# Altium schematic sheet PERIPHERAL POWER SUPPLY.SchDoc
size A3; SheetNumber: 16; SheetTotal: 17
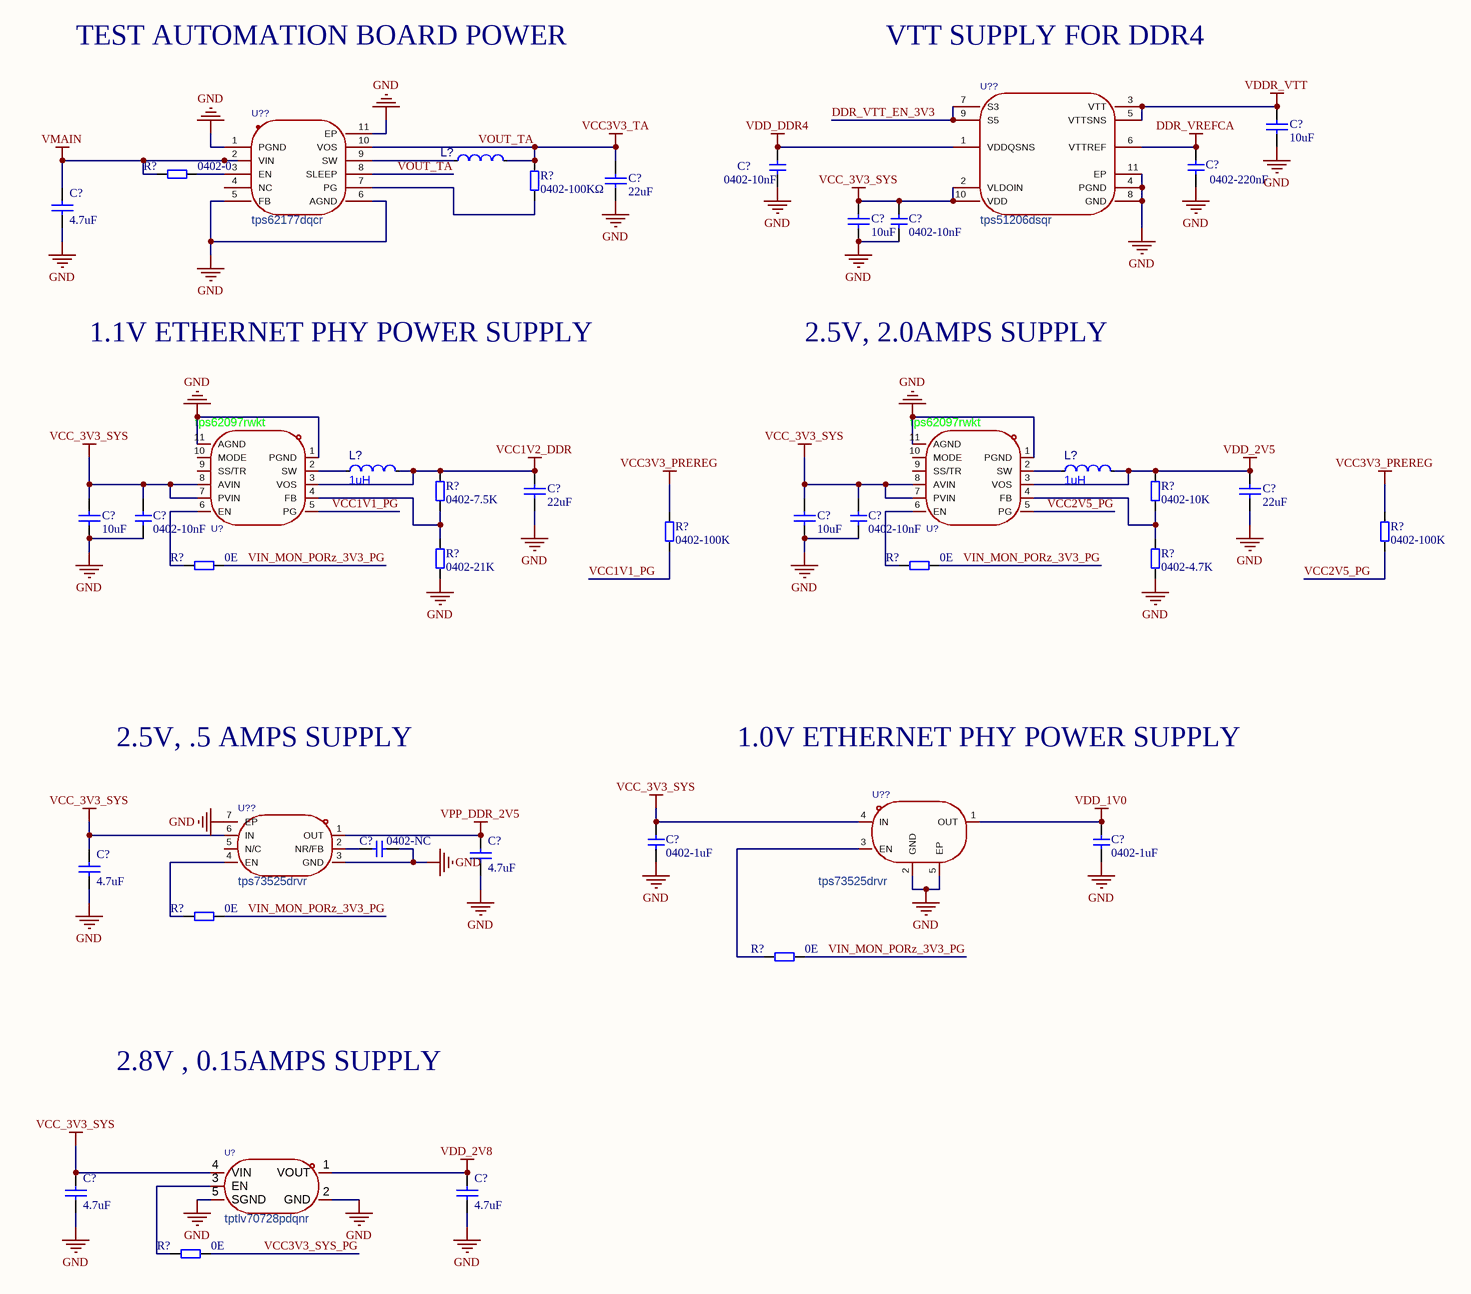
[diagram p0: PERIPHERAL POWER SUPPLY.SchDoc]

## Parts
(Parts that share a designator on the sheet are numbered #1, #2 ... from top to bottom, then left to right.)
C?#1  10uF  [C0603]
C?#2  0402-10nF  [C0402]
C?#3  0402-220nF  [C0402]
C?#4  22uF  [C0805]
C?#5  4.7uF  [C0603]
C?#6  0402-10nF  [C0402]
C?#7  10uF  [C0603]
C?#8  22uF  [C0805]
C?#9  22uF  [C0805]
C?#10  0402-10nF  [C0402]
C?#11  0402-10nF  [C0402]
C?#12  10uF  [C0603]
C?#13  10uF  [C0603]
C?#14  0402-1uF  [C0402]
C?#15  0402-1uF  [C0402]
C?#16  0402-NC  [C0402]
C?#17  4.7uF  [C0603]
C?#18  4.7uF  [C0603]
C?#19  4.7uF  [C0603]
C?#20  4.7uF  [C0603]
L?#1  fxl0630-100-m  [IND-SMD_L7.3-W6.8]  (value not drawn)
L?#2  1uH  [L0603]
L?#3  1uH  [L0603]
R?#1  0402-0  [R0402]
R?#2  0402-100KΩ  [R0402]
R?#3  0402-7.5K  [R0402]
R?#4  0402-10K  [R0402]
R?#5  0402-100K  [R0402]
R?#6  0402-100K  [R0402]
R?#7  0E  [R0402]
R?#8  0E  [R0402]
R?#9  0402-21K  [R0402]
R?#10  0402-4.7K  [R0402]
R?#11  0E  [R0402]
R?#12  0E  [R0402]
R?#13  0E  [R0402]
U?#1  tps62097rwkt  [VQFN-11_L2.0-W2.0-P0.50-TL_TI_RWK]
U?#2  tps62097rwkt  [VQFN-11_L2.0-W2.0-P0.50-TL_TI_RWK]
U?#3  tptlv70728pdqnr  [UDFN-4_L1.0-W1.0-P0.65-TL]
U??#1  tps51206dsqr  [SON-10_L2.0-W2.0-P0.40-TL-EP]
U??#2  tps62177dqcr  [WSON-10_L3.0-W2.0-P0.50-BL-EP]
U??#3  tps73525drvr  [WSON-6_L2.0-W2.0-P0.65-TL-EP]
U??#4  tps73525drvr  [WSON-6_L2.0-W2.0-P0.65-TL-EP]

## Nets
DDR_VREFCA: C?#3.1 U??#1.6(VTTREF)
GND: C?#1.1 C?#2.2 C?#3.2 C?#4.1 C?#5.1 C?#6.2 C?#7.1 C?#8.1 C?#9.1 C?#10.2 C?#11.2 C?#12.1 C?#13.1 C?#14.2 C?#15.2 C?#16.2 C?#17.1 C?#18.1 C?#19.1 C?#20.1 R?#9.1 R?#10.1 U?#1.1(PGND) U?#1.11(AGND) U?#2.1(PGND) U?#2.11(AGND) U?#3.2(GND) U?#3.5(SGND) U??#1.4(PGND) U??#1.8(GND) U??#1.11(EP) U??#2.1(PGND) U??#2.5(FB) U??#2.6(AGND) U??#2.11(EP) U??#3.2(GND) U??#3.5(EP) U??#4.3(GND) U??#4.7(EP)
VCC1V2_DDR: C?#8.2 L?#2.2 R?#3.2 U?#1.3(VOS)
VCC3V3_PREREG: R?#5.2 R?#6.2
VCC_3V3_SYS: C?#6.1 C?#7.2 C?#10.1 C?#11.1 C?#12.2 C?#13.2 C?#14.1 C?#18.2 C?#19.2 U?#1.7(PVIN) U?#1.8(AVIN) U?#2.7(PVIN) U?#2.8(AVIN) U?#3.4(VIN) U??#1.2(VLDOIN) U??#1.10(VDD) U??#3.4(IN) U??#4.6(IN)
VDD_1V0: C?#15.1 U??#3.1(OUT)
VDD_2V5: C?#9.2 L?#3.2 R?#4.2 U?#2.3(VOS)
VDD_2V8: C?#20.2 U?#3.1(VOUT)
VDD_DDR4: C?#2.1 U??#1.1(VDDQSNS)
VDDR_VTT: C?#1.2 U??#1.3(VTT) U??#1.5(VTTSNS)
VMAIN: C?#5.2 R?#1.1 U??#2.2(VIN)
VOUT_TA: C?#4.2 L?#1.2 R?#2.2 U??#2.8(SLEEP) U??#2.10(VOS)  [also labelled VCC3V3_TA]
VPP_DDR_2V5: C?#17.2 U??#4.1(OUT)
DDR_VTT_EN_3V3: U??#1.7(S3) U??#1.9(S5)
VCC1V1_PG: R?#5.1 U?#1.5(PG)
VCC2V5_PG: R?#6.1 U?#2.5(PG)
VCC3V3_SYS_PG: R?#13.1
VIN_MON_PORz_3V3_PG: R?#7.1 R?#8.1 R?#11.1 R?#12.1
NetC?#16_1: C?#16.1 U??#4.2(NR/FB)
NetL?#1_1: L?#1.1 U??#2.9(SW)
NetL?#2_1: L?#2.1 U?#1.2(SW)
NetL?#3_1: L?#3.1 U?#2.2(SW)
NetR?#1_2: R?#1.2 U??#2.3(EN)
NetR?#2_1: R?#2.1 U??#2.7(PG)
NetR?#3_1: R?#3.1 R?#9.2 U?#1.4(FB)
NetR?#4_1: R?#4.1 R?#10.2 U?#2.4(FB)
NetR?#7_2: R?#7.2 U?#1.6(EN)
NetR?#8_2: R?#8.2 U?#2.6(EN)
NetR?#11_2: R?#11.2 U??#4.4(EN)
NetR?#12_2: R?#12.2 U??#3.3(EN)
NetR?#13_2: R?#13.2 U?#3.3(EN)

Not connected (* = marked no-connect by the designer): U?#1 9(SS/TR) 10(MODE); U?#2 9(SS/TR) 10(MODE); U??#2 4(NC); U??#4 5(N/C)

## Notes on the sheet
- TEST AUTOMATION BOARD POWER
- VTT SUPPLY FOR DDR4
- 1.1V ETHERNET PHY POWER SUPPLY
- 2.5V, 2.0AMPS SUPPLY
- 2.5V, .5 AMPS SUPPLY
- 1.0V ETHERNET PHY POWER SUPPLY
- 2.8V , 0.15AMPS SUPPLY

## Library data of the parts
C?#1 C?#5 C?#7 C?#12 C?#13 C?#17-C?#20 = C0603: Capacitor; Value: 104; Published: 8-Jun-2000; LatestRevisionDate: 17-Jul-2002; LatestRevisionNote: Re-released for DXP Platform.; Publisher: Altium Limited
C?#2 C?#3 C?#6 C?#10 C?#11 C?#14-C?#16 = C0402: 物料号: *; 物料描述: *
C?#4 C?#8 C?#9 = C0805: Capacitor; Value: 104; Published: 8-Jun-2000; LatestRevisionDate: 17-Jul-2002; LatestRevisionNote: Re-released for DXP Platform.; Publisher: Altium Limited
L?#1 = fxl0630-100-m: 电感值:6.8uH;精度:±20%;额定电流:4.5A;饱和电流(Isat):5.5A;类型:一体成型电感;; Manufacturer: cjiang(长江微电); AddInBom: yes; ModelId: e28854526ca747668ea12fbe1dd39a63; ModelName: IND-SMD_L7.3-W6.8-H3.0; ModelTransform: 292.125,267.716,0,0,0,0,0,0,0; Value: 10uH; Tolerance: ±20%; Current Rating: 4.5A; Current - Saturation(Isat): 5.5A; DC Resistance(DCR): 68mΩ; Type: 一体成型电感; Symbol: FXL0630-100-M; LCSC Part Name: 10uH ±20% 5.5A; SupplierPart: C167223; ManufacturerPart: FXL0630-100-M; Supplier Footprint: SMD,7x6.6mm; JLCPCB Part Class: Extended Part; Datasheet: https://item.szlcsc.com/datasheet/FXL0630-100-M/178606.html; Supplier: LCSC; ConvertToPcb: yes; FootprintName: IND-SMD_L7.3-W6.8; Ratings: -
L?#2 L?#3 = L0603: 小型化一体成型T-CORE，小体积，扁线工艺，感值小，1210​ 1uH ±20% 6A PCT322510-1R0-M; Manufacturer: Sunlord(顺络); Symbol: SDFL1608S100KTF; AddInBom: yes; ModelId: 2bc5ec593d464d6ba9807aec0b5673c2; ModelName: L0603_L1.6-W0.8-H0.5_BEAD; ModelTransform: 62.992,31.496,0,180,0,0,0.094,0.629,0; Value: 10uH; Tolerance: ±10%; Current Rating: 3mA; DC Resistance(DCR): 1.85Ω; Q @ Frequency: 30@2MHz; Frequency - Self Resonant: 17MHz; LCSC Part Name: 10uH ±10%; SupplierPart: C1035; ManufacturerPart: SDFL1608S100KTF; Supplier Footprint: 0603; JLCPCB Part Class: Basic Part; Datasheet: https://item.szlcsc.com/datasheet/SDFL1608S100KTF/1387.html; Supplier: LCSC; ConvertToPcb: yes; FootprintName: L0603; Current - Saturation (Isat): -; Ratings: -
R?#1-R?#13 = R0402: 片式电阻; 物料描述: 片式电阻器-0805-10KΩ-5%-JT; 物料号: NA
U?#1 U?#2 = tps62097rwkt: 功能类型:降压型;工作电压:2.5V~6V;输出电压:800mV~6V;输出电流:2A;输出类型:可调;; Manufacturer: TI(德州仪器); AddInBom: yes; Function: 降压型; Output Current: 2A; Frequency - Switching: 2.5MHz; Synchronous Rectifier: 是; Number of Outputs: 1; Topology: 降压式; Quiescent Current: 57uA; Switch tube (built-in/external): 内置; Output Type: 可调; Symbol: TPS62097RWKT; LCSC Part Name: 降压型 2A 2.5V~6V; SupplierPart: C2073254; ManufacturerPart: TPS62097RWKT; Supplier Footprint: VQFN-11(2x2); JLCPCB Part Class: Extended Part; Datasheet: https://www.ti.com/cn/lit/gpn/tps62097; Supplier: LCSC; ConvertToPcb: yes; FootprintName: VQFN-11_L2.0-W2.0-P0.50-TL_TI_RWK; Voltage - Supply: 2.5V~6V; Output Voltage: 800mV~6V; Operating Temperature: -40℃~+125℃@(TJ); Features: 轻载高效模式；可调软启动；输出放电；输出电压跟随；工作状态指示；打嗝限流
U?#3 = tptlv70728pdqnr: Manufacturer: TECH PUBLIC(台舟); AddInBom: yes; ModelId: 9c2eebc267f642aab45e7193d1ab7813; ModelTransform: 40.1574,39.37394,0,0,0,0,0,0,0; LCSC Part Name: TPTLV70728PDQNR; SupplierPart: C55191407; ManufacturerPart: TPTLV70728PDQNR; Supplier Footprint: DFN-4(1x1); JLCPCB Part Class: Extended Part; Datasheet: https://item.szlcsc.com/datasheet/TPTLV70728PDQNR/58985584.html; Supplier: LCSC; ConvertToPcb: yes; SymbolName: TPTLV70728PDQNR; FootprintName: UDFN-4_L1.0-W1.0-P0.65-TL; ModelName: UDFN-4_L1.0-W1.0-P0.65-TL
U??#1 = tps51206dsqr: 输出极性:正极;工作电压:6.5V;输出电压:500mV~900mV;输出电流:2A;电源纹波抑制比(PSRR):-;输出类型:-;; Manufacturer: TI(德州仪器); AddInBom: yes; ModelId: 67ee0328d4a549d7a6ffbda5a640ba02; ModelName: SON-10_L2.0-W2.0-H0.9-P0.40-TL-EP; ModelTransform: 78.74,79.527,0,270,0,0,0,0,0; Output Configuration: 正极; Voltage - Supply: 6.5V; Output Current: 2A; standby current: 170uA; Number of Outputs: 2; Symbol: TPS51206DSQR; LCSC Part Name: 500mV~900mV 2A 6.5V; SupplierPart: C88038; ManufacturerPart: TPS51206DSQR; Supplier Footprint: SON-10-EP(2x2); JLCPCB Part Class: Extended Part; Datasheet: https://www.ti.com/cn/lit/ds/symlink/tps51206.pdf; Supplier: LCSC; ConvertToPcb: yes; FootprintName: SON-10_L2.0-W2.0-P0.40-TL-EP; Output Voltage: 500mV~900mV; Power Supply Rejection Ratio (PSRR): -; Voltage Dropout: -; Noise: -; Features: 输入欠压保护；输出放电；热关断; Operating Temperature: -40℃~+85℃; Output Type: -
U??#2 = tps62177dqcr: 功能类型:降压型;工作电压:4.75V~28V;输出电压:3.3V;输出电流:500mA;输出类型:固定;; Manufacturer: TI(德州仪器); AddInBom: yes; ModelId: 31d7ab64162b448781b010e9f8706f97; ModelName: WSON-10_L3.0-W2.0-H0.8-P0.50; ModelTransform: 79.527,118.11,0,90,0,0,0,0,0; Function: 降压型; Output Voltage: 3.3V; Output Current: 500mA; Frequency - Switching: 1MHz; Synchronous Rectifier: 是; Number of Outputs: 1; Topology: 降压式; Quiescent Current: 22uA; Switch tube (built-in/external): 内置; Output Type: 固定; Symbol: TPS62177DQCR; LCSC Part Name: 降压型 500mA 4.75V~28V; SupplierPart: C91241; ManufacturerPart: TPS62177DQCR; Supplier Footprint: WSON-10-EP(2x3); JLCPCB Part Class: Extended Part; Datasheet: https://www.ti.com/cn/lit/ds/symlink/tps62177.pdf; Supplier: LCSC; ConvertToPcb: yes; FootprintName: WSON-10_L3.0-W2.0-P0.50-BL-EP; Voltage - Supply: 4.75V~28V; Operating Temperature: -40℃~+125℃@(TJ); Features: 轻载高效模式；过流保护；输出放电；工作状态指示
U??#3 = TLV70710DQNR: 输出极性:正极;工作电压:6.5V;输出电压:2.5V;输出电流:500mA;电源纹波抑制比(PSRR):68dB@(1kHz);输出类型:固定;; Manufacturer: TI(德州仪器); AddInBom: yes; ModelId: 521c6d8f59ad4736925338f4a59f8ef4; ModelName: WSON-6_L2.0-W2.0-H0.8-P0.65; ModelTransform: 79.527,78.74,0,0,0,0,0,0,0; Output Configuration: 正极; Voltage - Supply: 6.5V; Output Voltage: 2.5V; Output Current: 500mA; Voltage Dropout: 280mV@(500mA); standby current: 45uA; Noise: 13.2uVrms; Output Type: 固定; Number of Outputs: 1; Symbol: TPS73525DRVR; LCSC Part Name: 500mA 6.5V; SupplierPart: C2870409; ManufacturerPart: TPS73525DRVR; Supplier Footprint: WSON-6-EP(2x2); JLCPCB Part Class: Extended Part; Datasheet: https://www.ti.com/cn/lit/ds/symlink/tps735.pdf; Supplier: LCSC; ConvertToPcb: yes; FootprintName: WSON-6_L2.0-W2.0-P0.65-TL-EP; Power Supply Rejection Ratio (PSRR): 68dB@(1kHz); Features: 使能控制；输入欠压保护；噪声旁路端子；过流保护；热关断; Operating Temperature: -40℃~+125℃@(Tj)
U??#4 = tps73525drvr: 输出极性:正极;工作电压:6.5V;输出电压:2.5V;输出电流:500mA;电源纹波抑制比(PSRR):68dB@(1kHz);输出类型:固定;; Manufacturer: TI(德州仪器); AddInBom: yes; ModelId: 521c6d8f59ad4736925338f4a59f8ef4; ModelName: WSON-6_L2.0-W2.0-H0.8-P0.65; ModelTransform: 79.527,78.74,0,0,0,0,0,0,0; Output Configuration: 正极; Voltage - Supply: 6.5V; Output Voltage: 2.5V; Output Current: 500mA; Voltage Dropout: 280mV@(500mA); standby current: 45uA; Noise: 13.2uVrms; Output Type: 固定; Number of Outputs: 1; Symbol: TPS73525DRVR; LCSC Part Name: 500mA 6.5V; SupplierPart: C2870409; ManufacturerPart: TPS73525DRVR; Supplier Footprint: WSON-6-EP(2x2); JLCPCB Part Class: Extended Part; Datasheet: https://www.ti.com/cn/lit/ds/symlink/tps735.pdf; Supplier: LCSC; ConvertToPcb: yes; FootprintName: WSON-6_L2.0-W2.0-P0.65-TL-EP; Power Supply Rejection Ratio (PSRR): 68dB@(1kHz); Features: 使能控制；输入欠压保护；噪声旁路端子；过流保护；热关断; Operating Temperature: -40℃~+125℃@(Tj)